# Altium project STM32 DevBoard.PrjPcb
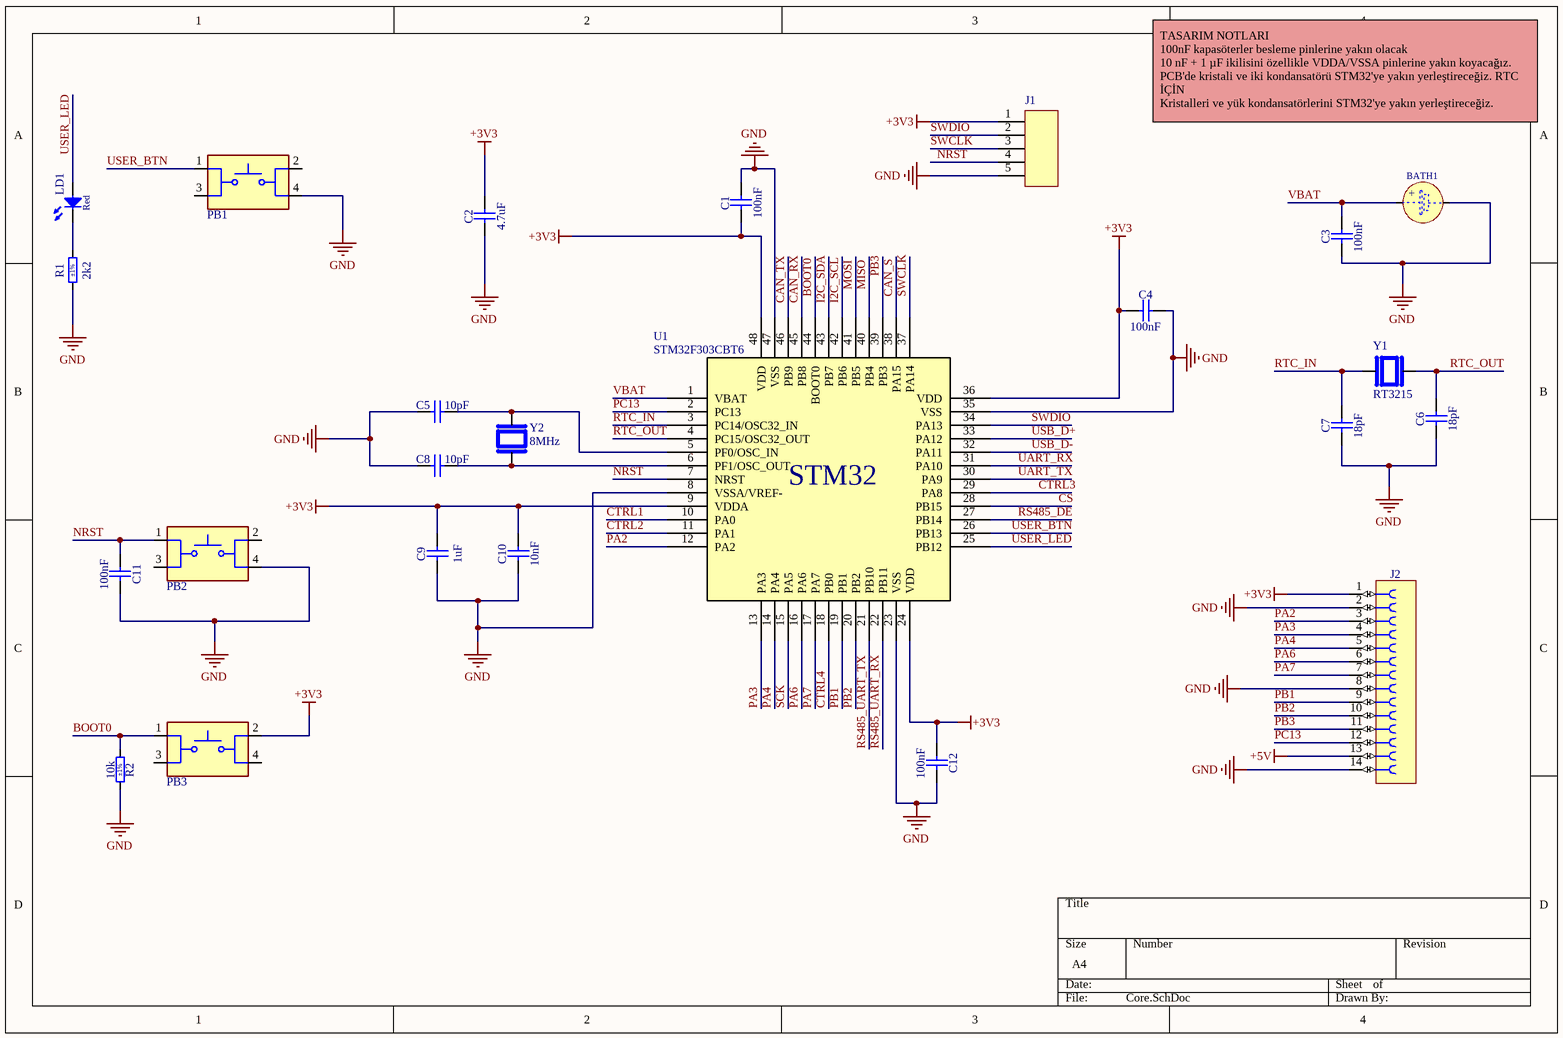
[diagram p0: Core.SchDoc]
3 sheets, 79 parts. Net scope: global (net labels, ports and power ports of the same name join across sheets).
Board file: STM32_DevBoard.PcbDoc
Sheets:
  Core.SchDoc
  Power.SchDoc
  Com.SchDoc

## Sheet Core.SchDoc
size A4; SheetNumber: 1; SheetTotal: 3

### Parts
BATH1  (no value)  [BATH_KEYSTONE_3000]
C1  100nF  [CAPC1608X87N]
C2  4.7uF  [CAPC1608X90N]
C3  100nF  [CAPC1608X87N]
C4  100nF  [CAPC1608X87N]
C5  10pF  [CAPC1608X87N]
C6  18pF  [CAPC1608X87N]
C7  18pF  [CAPC1608X87N]
C8  10pF  [CAPC1608X87N]
C9  1uF  [CAPC1608X87N]
C10  10nF  [CAPC1608X87N]
C11  100nF  [CAPC1608X87N]
C12  100nF  [CAPC1608X87N]
J1  Pin Header 1x5  [Pin Header 1x5 2.54mm]  (value not drawn)
J2  Socket 14  [SAMTEC_SSW-107-01-G-D]  (value not drawn)
LD1  Red  [LED_KINGBRIGHT_KPH-1608SURCK]
PB1  4.5mm x 4.5mm  [L-KLS7-TS4502-6.5-180-T]  (value not drawn)
PB2  4.5mm x 4.5mm  [L-KLS7-TS4502-6.5-180-T]  (value not drawn)
PB3  4.5mm x 4.5mm  [L-KLS7-TS4502-6.5-180-T]  (value not drawn)
R1  2k2  Tolerance: ±1%  [RESC1608X55N]
R2  10k  Tolerance: ±1%  [RESC1608X55N]
U1  STM32F303CBT6  [STM32F303CBT6]
Y1  RT3215  [RT3215-32.768-12.5-TR]
Y2  8MHz  [H130A-8.000-8-2030-TR]

### Nets
+3V3: C1.1 C2.2 C4.1 C9.2 C10.2 C12.1 J1.1 J2.1 PB3.2 U1.9(VDDA) U1.24(VDD) U1.36(VDD) U1.48(VDD)
+5V: J2.13
GND: BATH1.2(MINUS) C1.2 C2.1 C3.1 C4.2 C5.1 C6.1 C7.1 C8.1 C9.1 C10.1 C11.2 C12.2 J1.5 J2.2 J2.8 J2.14 PB1.4 PB2.4 R1.1 R2.2 U1.8(VSSA/VREF-) U1.23(VSS) U1.35(VSS) U1.47(VSS)
BOOT0: PB3.1 R2.1 U1.44(BOOT0)
CAN_RX: U1.45(PB8)
CAN_S: U1.38(PA15)
CAN_TX: U1.46(PB9)
CS: U1.28(PB15)
CTRL1: U1.10(PA0)
CTRL2: U1.11(PA1)
CTRL3: U1.29(PA8)
CTRL4: U1.18(PB0)
I2C_SCL: U1.42(PB6)
I2C_SDA: U1.43(PB7)
MISO: U1.40(PB4)
MOSI: U1.41(PB5)
NRST: C11.1 J1.4 PB2.1 U1.7(NRST)
PA2: J2.3 U1.12(PA2)
PA3: J2.4 U1.13(PA3)
PA4: J2.5 U1.14(PA4)
PA6: J2.6 U1.16(PA6)
PA7: J2.7 U1.17(PA7)
PB1: J2.9 U1.19(PB1)
PB2: J2.10 U1.20(PB2)
PB3: J2.11 U1.39(PB3)
PC13: J2.12 U1.2(PC13)
RS485_DE: U1.27(PB14)
RS485_UART_RX: U1.22(PB11)
RS485_UART_TX: U1.21(PB10)
RTC_IN: C7.2 U1.3(PC14/OSC32_IN) Y1.1
RTC_OUT: C6.2 U1.4(PC15/OSC32_OUT) Y1.2
SCK: U1.15(PA5)
SWCLK: J1.3 U1.37(PA14)
SWDIO: J1.2 U1.34(PA13)
UART_RX: U1.31(PA10)
UART_TX: U1.30(PA9)
USB_D+: U1.33(PA12)
USB_D-: U1.32(PA11)
USER_BTN: PB1.1 U1.26(PB13)
USER_LED: LD1.2(A) U1.25(PB12)
VBAT: BATH1.1(PLUS) C3.2 U1.1(VBAT)
NetC5_2: C5.2 U1.5(PF0/OSC_IN) Y2.2
NetC8_2: C8.2 U1.6(PF1/OSC_OUT) Y2.1
NetLD1_1: LD1.1(C) R1.2

Not connected (* = marked no-connect by the designer): PB1 2 3; PB2 2 3; PB3 3 4

### Notes on the sheet
- TASARIM NOTLARI
  100nF kapasöterler besleme pinlerine yakın olacak
  10 nF + 1 µF ikilisini özellikle VDDA/VSSA pinlerine yakın koyacağız.
  PCB'de kristali ve iki kondansatörü STM32'ye yakın yerleştireceğiz. RTC İÇİN
  Kristalleri ve yük kondansatörlerini STM32'ye yakın yerleştireceğiz.
- (in symbol BATH_KEYSTONE_3000) +
- (in symbol STM32F303CBT6) STM32

### Library data of the parts
BATH1 = BATH_KEYSTONE_3000: Battery Holder whit 2 Pin; Part Description: SMD Battery Holder for CR1216, BR1220, CL1225, SR1120, D381, 391, 191 Coin Cells; Manufacturer Part Number: 3000; PressFit: No; Part Number: BATH_KEYSTONE_3000; Component Kind: Standard; Component Type: Standard; Pin Count: 3; PackageDescription: SMD Battery Holder for CR1216, BR1220, CL1225, SR1120, D381, 391, 191 Coin Cells; Family: Battery; Mounted: Yes; Socket: No; SMD: Yes; Sense: No; Manufacturer: KEYSTONE; ComponentHeight: 3.17mm; HelpURL: \\cern.ch\dfs\Applications\Altium\Datasheets\BATH_KEYSTONE_3000.pdf; Author: CERN DEM JLC; CreateDate: 17.04.2012; LatestRevisionDate: 7.06.2017
C1 C3 C4 C11 C12 = CC0603_100NF_50V_10%_X5R: Non-polarised capacitor; Part Description: SMD Multilayer Chip Ceramic Capacitor; Manufacturer: GENERIC; Manufacturer1 Part Number: C1608X5R1H104K080; Voltage: 50V; TC: X5R; Tolerance: ±10%; Part Number: CC0603_100NF_50V_10%_X5R; Component Kind: Standard; Component Type: Standard; Pin Count: 2; Value: 100nF; Status: None; Manufacturer Part Number: CC0603_100NF_50V_10%_X5R; Case: 0603; Mounted: Yes; Socket: No; SMD: Yes; Sense: No; Manufacturer1 Example: TDK; Manufacturer1 ComponentHeight: 0.9mm; HelpURL: \\cern.ch\dfs\Applications\Altium\Datasheets\CC0603_X5R_TDK_C.pdf; Author: CERN DEM MR; CreateDate: 8.01.2016; LatestRevisionDate: 8.01.2016
C2 = CC0603_4.7UF_25V_10%_X5R: Non-polarised capacitor; Part Description: SMD Multilayer Chip Ceramic Capacitor; Manufacturer: GENERIC; Manufacturer1 Part Number: GRM188R61E475KE11D; Voltage: 25V; TC: X5R; Tolerance: ±10%; Part Number: CC0603_4.7UF_25V_10%_X5R; Component Kind: Standard; Component Type: Standard; Pin Count: 2; Value: 4.7uF; Status: None; Manufacturer Part Number: CC0603_4.7UF_25V_10%_X5R; Case: 0603; Mounted: Yes; Socket: No; SMD: Yes; Sense: No; Manufacturer1 Example: MURATA; Manufacturer1 ComponentHeight: 0.95mm; HelpURL: \\cern.ch\dfs\Applications\Altium\Datasheets\CC0603_MURATA_GRM188R61E475KE11D.pdf; Author: CERN DEM JLC; CreateDate: 10.11.2014; LatestRevisionDate: 10.11.2014
C5 C8 = CC0603_10PF_50V_5%_NP0: Non-polarised capacitor; Part Description: SMD Multilayer Chip Ceramic Capacitor; Manufacturer: GENERIC; Manufacturer1 Part Number: 223886715109; Voltage: 50V; TC: C0G/NP0; Tolerance: ±5%; Part Number: CC0603_10PF_50V_5%_NP0; Component Kind: Standard; Component Type: Standard; Pin Count: 2; Value: 10pF; Status: Preferred; Manufacturer Part Number: CC0603_10PF_50V_5%_NP0; Case: 0603; Mounted: Yes; Socket: No; SMD: Yes; Sense: No; Manufacturer1 Example: PHYCOMP; Manufacturer1 ComponentHeight: 0.87mm; HelpURL: \\cern.ch\dfs\Applications\Altium\Datasheets\CC0603_NP0_PHYCOMP.pdf; Author: CERN DEM JLC; CreateDate: 3.12.2007; LatestRevisionDate: 3.12.2007
C6 C7 = CC0603_18PF_50V_5%_NP0: Non-polarised capacitor; Part Description: SMD Multilayer Chip Ceramic Capacitor; Manufacturer: GENERIC; Manufacturer1 Part Number: 223886715189; Voltage: 50V; TC: C0G/NP0; Tolerance: ±5%; Part Number: CC0603_18PF_50V_5%_NP0; Component Kind: Standard; Component Type: Standard; Pin Count: 2; Value: 18pF; Status: Preferred; Manufacturer Part Number: CC0603_18PF_50V_5%_NP0; Case: 0603; Mounted: Yes; Socket: No; SMD: Yes; Sense: No; Manufacturer1 Example: PHYCOMP; Manufacturer1 ComponentHeight: 0.87mm; HelpURL: \\cern.ch\dfs\Applications\Altium\Datasheets\CC0603_NP0_PHYCOMP.pdf; Author: CERN DEM JLC; CreateDate: 3.12.2007; LatestRevisionDate: 3.12.2007
C9 = CC0603_1UF_25V_10%_X7R: Non-polarised capacitor; Part Description: SMD Multilayer Chip Ceramic Capacitor; Manufacturer: GENERIC; Manufacturer1 Part Number: GRM188R71E105KA12D; Voltage: 25V; TC: X7R; Tolerance: ±10%; Part Number: CC0603_1UF_25V_10%_X7R; Component Kind: Standard; Component Type: Standard; Pin Count: 2; Value: 1uF; Status: None; Manufacturer Part Number: CC0603_1UF_25V_10%_X7R; Case: 0603; Mounted: Yes; Socket: No; SMD: Yes; Sense: No; Manufacturer1 Example: MURATA; Manufacturer1 ComponentHeight: 0.9mm; HelpURL: \\cern.ch\dfs\Applications\Altium\Datasheets\CC0603_X7R_MURATA.pdf; Author: CERN DEM JLC; CreateDate: 18.01.2011; LatestRevisionDate: 18.01.2011
C10 = CC0603_10NF_50V_10%_X7R: Non-polarised capacitor; Part Description: SMD Multilayer Chip Ceramic Capacitor; Manufacturer: GENERIC; Manufacturer1 Part Number: 223858615636; Voltage: 50V; TC: X7R; Tolerance: ±10%; Part Number: CC0603_10NF_50V_10%_X7R; Component Kind: Standard; Component Type: Standard; Pin Count: 2; Value: 10nF; Status: Preferred; Manufacturer Part Number: CC0603_10NF_50V_10%_X7R; Case: 0603; Mounted: Yes; Socket: No; SMD: Yes; Sense: No; Manufacturer1 Example: PHYCOMP; Manufacturer1 ComponentHeight: 0.87mm; HelpURL: \\cern.ch\dfs\Applications\Altium\Datasheets\CC0603_X7R_PHYCOMP.pdf; Author: CERN DEM JLC; CreateDate: 3.12.2007; LatestRevisionDate: 3.12.2007
J1 = Pin Header 1x5 2.54mm: PIN HEADER 5PIN(1x5) 2.54mm THT V/T 3X6MM
J2 = SAMTEC_SSW-107-01-G-D: Connector 14 Female; Part Description: 14 Contacts, Pitch 2.54mm, Dual Row Through Mount Straight Socket (Lead Length 2.64mm); Manufacturer: SAMTEC; PressFit: No; Part Number: SAMTEC_SSW-107-01-G-D; Component Kind: Standard; Component Type: Standard; Pin Count: 14; Family: Socket 14; Mounted: Yes; Socket: No; SMD: No; Sense: No; Status: None; Manufacturer Part Number: SSW-107-01-G-D; ComponentHeight: 8.51mm; HelpURL: \\cern.ch\dfs\Applications\Altium\Datasheets\SAMTEC_SSW-107-01-G-D.pdf; Author: CERN DEM MR; CreateDate: 10.03.2016; LatestRevisionDate: 10.03.2016
LD1 = LED_KINGBRIGHT_KPH-1608SURCK: LED Red 1C 2A; Part Description: SMD Hyper Red LED, Case 1.6mmX0.8mm(0603), 0.65mm Thickness; PressFit: No; Bonding: No; Part Number: LED_KINGBRIGHT_KPH-1608SURCK; Component Kind: Standard; Component Type: Standard; Color: Red; PackageDescription: SMT Hyper Red LED, Case 0603, Body L 1.6 x W 0.8mm H 0.65mm; Manufacturer: KINGBRIGHT; Manufacturer Part Number: KPH-1608SURCK; Pin Count: 2; Case: 0603; Mounted: Yes; Socket: No; SMD: Yes; Sense: No; ComponentHeight: 0.65mm; HelpURL: \\cern.ch\dfs\Applications\Altium\Datasheets\LED_KINGBRIGHT_KPH-1608SURCK.pdf; Author: CERN DEM JLC; CreateDate: 3.07.2017; LatestRevisionDate: 3.07.2017
PB1-PB3 = L-KLS7-TS4502-6.5-180-T: SWITCH TACT 4.5x4.5MM 6.5MM 180gf SMD
R1 = R0603_2K2_1%_0.1W_100PPM: Resistor - 1%; Part Description: General Purpose Thick Film Chip Resistor; Manufacturer: GENERIC; Manufacturer1 Part Number: NRC06F2201TRF; Power: 0.1W; TC: ±100ppm/°C; PressFit: No; Part Number: R0603_2K2_1%_0.1W_100PPM; Component Kind: Standard; Component Type: Standard; Pin Count: 2; Value: 2k2; Status: Preferred; Manufacturer Part Number: R0603_2K2_1%_0.1W_100PPM; Case: 0603; Mounted: Yes; Sense: No; Socket: No; SMD: Yes; Manufacturer1 Example: NIC COMPONENT; Manufacturer1 ComponentHeight: 0.55mm; HelpURL: \\cern.ch\dfs\Applications\Altium\Datasheets\R0603_NIC_NRC.pdf; Author: CERN DEM JLC; CreateDate: 3.12.2007; LatestRevisionDate: 13.03.2008
R2 = R0603_10K_1%_0.1W_100PPM: Resistor - 1%; Part Description: General Purpose Thick Film Chip Resistor; Manufacturer: GENERIC; Manufacturer1 Part Number: NRC06F1002TRF; Power: 0.1W; TC: ±100ppm/°C; PressFit: No; Part Number: R0603_10K_1%_0.1W_100PPM; Component Kind: Standard; Component Type: Standard; Pin Count: 2; Value: 10k; Status: Preferred; Manufacturer Part Number: R0603_10K_1%_0.1W_100PPM; Case: 0603; Mounted: Yes; Sense: No; Socket: No; SMD: Yes; Manufacturer1 Example: NIC COMPONENT; Manufacturer1 ComponentHeight: 0.55mm; HelpURL: \\cern.ch\dfs\Applications\Altium\Datasheets\R0603_NIC_NRC.pdf; Author: CERN DEM JLC; CreateDate: 3.12.2007; LatestRevisionDate: 13.03.2008
Y1 = RT3215-32.768-12.5-TR: CRYSTAL 32.768kHz 12.5pF 20PPM SMD TR
Y2 = H130A-8.000-8-2030-TR: CRYSTAL 8MHz 8pF 20PPM SMT

## Sheet Power.SchDoc
size A4; SheetNumber: 2; SheetTotal: 3
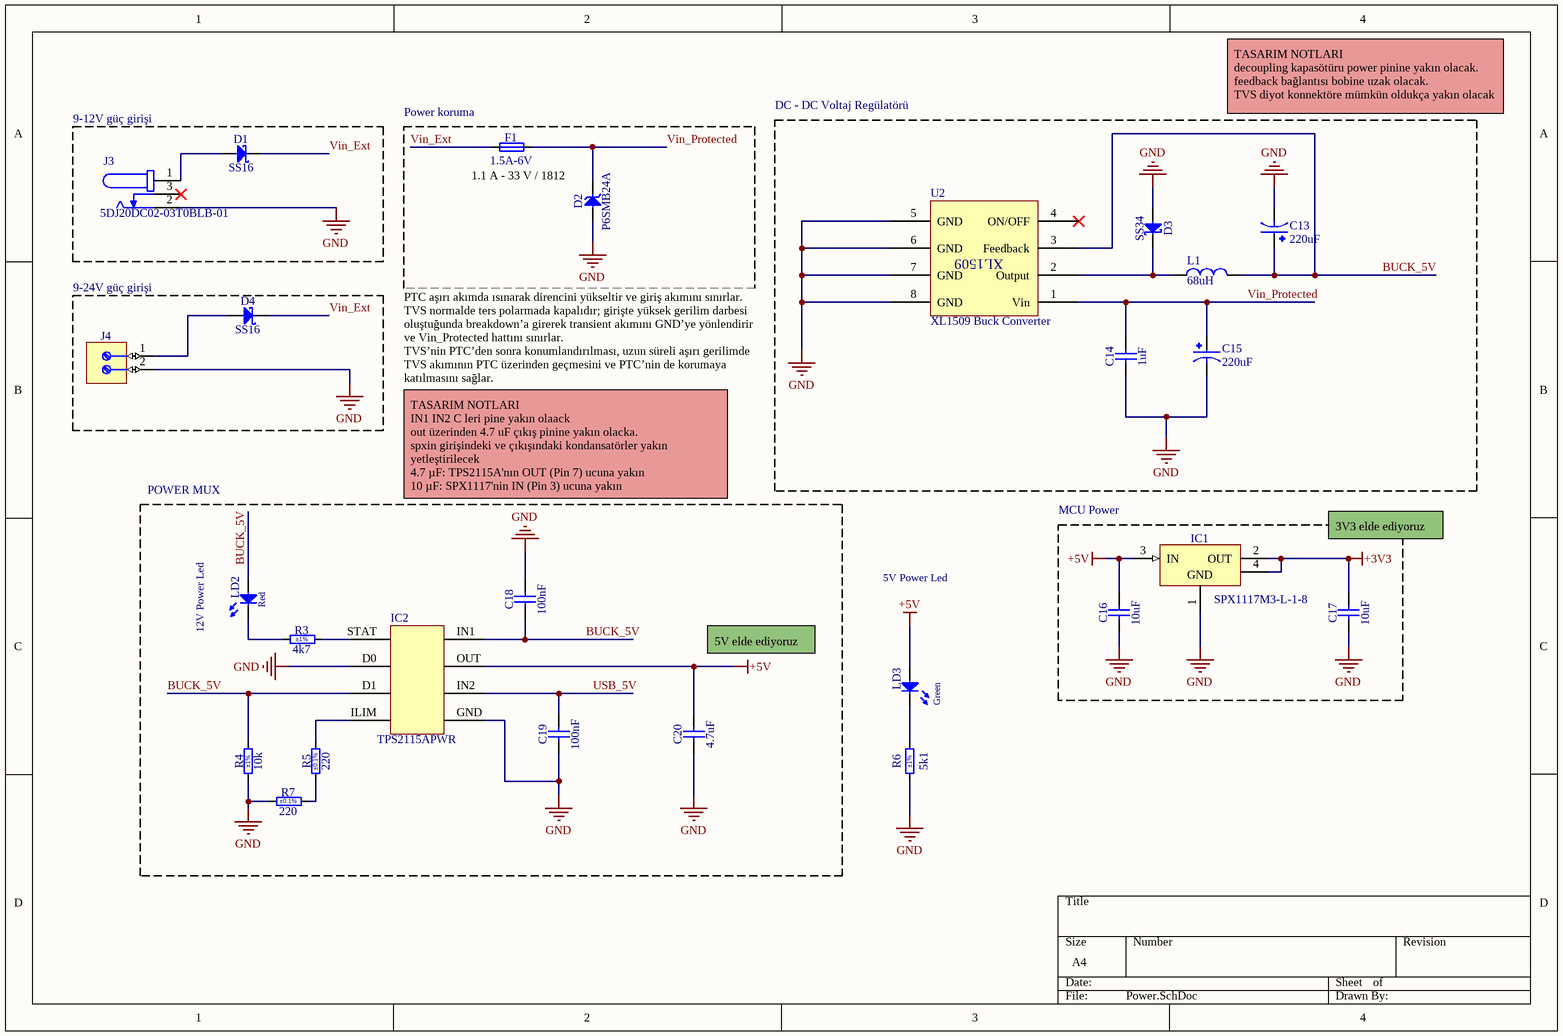
[diagram p1: Power.SchDoc]

### Parts
C13  220uF  [CD035M221G10PKKKV00A]
C14  1uF  [CAPC2012X110N]
C15  220uF  [CD035M221G10PKKKV00A]
C16  10uF  [CAPC1608X80N]
C17  10uF  [CAPC1608X80N]
C18  100nF  [CAPC1608X87N]
C19  100nF  [CAPC1608X87N]
C20  4.7uF  [CAPC1608X90N]
D1  SS16  [DIOM5127X229N]
D2  P6SMB24A  [DIOM5436X261N]
D3  SS34  [DIOM7959X265N]
D4  SS16  [DIOM5127X229N]
F1  1.5A-6V  [FUSRC4632X90N]
IC1  SPX1117M3-L-1-8  [SOT230P700X180-4N]
IC2  TPS2115APWR  [TPS2115APWR]
J3  5DJ20DC02-03T0BLB-01  [5DJ20DC02-03T0BLB-01]
J4  (no value)  [PHOENIX_1751248]
L1  68uH  [SRI1207-680M]
LD2  Red  [LED_KINGBRIGHT_KPH-1608SURCK]
LD3  Green  [LED_KINGBRIGHT_KP-1608CGCK]
R3  4k7  Tolerance: ±1%  [RESC1608X55N]
R4  10k  Tolerance: ±1%  [RESC1608X55N]
R5  220  Tolerance: ±0.1%  [RESC1608X64N]
R6  5k1  Tolerance: ±1%  [RESC1608X55N]
R7  220  Tolerance: ±0.1%  [RESC1608X64N]
U2  XL1509 Buck Converter  [XL1509-5.0E1]

### Blocks framed on the sheet
9-12V güç girişi: D1 J3
Power koruma: D2 F1
DC - DC Voltaj Regülatörü: C13-C15 D3 L1 U2
9-24V güç girişi: D4 J4
POWER MUX: C18-C20 IC2 LD2 R3-R5 R7
MCU Power: C16 C17 IC1

### Nets
+3V3: C17.2 IC1.2(OUT) IC1.4(OUT)
+5V: C16.2 C20.2 IC1.3(IN) IC2.OUT LD3.2(A)
GND: C13.2(N) C14.1 C15.2(N) C16.1 C17.1 C18.2 C19.1 C20.1 D2.2(A) D3.2(A) IC1.1(GND) IC2.D0 IC2.GND J3.2(SWITCH) J4.2 R4.1 R6.1 R7.1 U2.5(GND) U2.6(GND) U2.7(GND) U2.8(GND)
BUCK_5V: C13.1(P) C18.1 IC2.D1 IC2.IN1 L1.2 LD2.2(A) R4.2 U2.3(Feedback)
USB_5V: C19.2 IC2.IN2
Vin_Ext: D1.1(C) D4.1(C) F1.1
Vin_Protected: C14.2 C15.1(P) D2.1(C) F1.2 U2.1(Vin)
NetD1_2: D1.2(A) J3.1(Vin)
NetD3_1: D3.1(C) L1.1 U2.2(Output)
NetD4_2: D4.2(A) J4.1
NetIC2_ILIM: IC2.ILIM R5.2
NetIC2_STAT: IC2.STAT R3.2
NetLD2_1: LD2.1(C) R3.1
NetLD3_1: LD3.1(C) R6.2
NetR5_1: R5.1 R7.2

Not connected (* = marked no-connect by the designer): J3 3(GND)*; U2 4(ON/OFF)*

### Notes on the sheet
- TASARIM NOTLARI
  decoupling kapasötüru power pinine yakın olacak.
  feedback bağlantısı bobine uzak olacak.
  TVS diyot konnektöre mümkün oldukça yakın olacak
- 1.1 A - 33 V / 1812
- PTC aşırı akımda ısınarak direncini yükseltir ve giriş akımını sınırlar.
  TVS normalde ters polarmada kapalıdır; girişte yüksek gerilim darbesi oluştuğunda breakdown’a girerek transient akımını GND’ye yönlendirir ve Vin_Protected hattını sınırlar.
  TVS’nin PTC’den sonra konumlandırılması, uzun süreli aşırı gerilimde TVS akımının PTC üzerinden geçmesini ve PTC’nin de korumaya katılmasını sağlar.
- TASARIM NOTLARI
  IN1 IN2 C leri pine yakın olaack
  out üzerinden 4.7 uF çıkış pinine yakın olacka.
  spxin girişindeki ve çıkışındaki kondansatörler yakın yetleştirilecek
  4.7 µF: TPS2115A'nın OUT (Pin 7) ucuna yakın
  10 µF: SPX1117'nin IN (Pin 3) ucuna yakın
- 5V Power Led
- 3V3 elde ediyoruz
- (near LD2) 12V Power Led
- 5V elde ediyoruz
- (in symbol XL1509-5.0E1) XL1509

### Library data of the parts
C13 C15 = CD035M221G10PKKKV00A: CAP.ALU 220uF 35V 10x10 ±20% 3000 Hrs @ 105 °C Radial Electrolytic AEC-Q200 SMT
C14 = CC0805_1UF_50V_10%_X7R: Non-polarised capacitor; Part Description: SMD Multilayer Chip Ceramic Capacitor; Manufacturer: GENERIC; Manufacturer1 Part Number: C0805C105K5RACTU; Voltage: 50V; TC: X7R; Tolerance: ±10%; Part Number: CC0805_1UF_50V_10%_X7R; Component Kind: Standard; Component Type: Standard; Pin Count: 2; Value: 1uF; Status: Preferred; Manufacturer Part Number: CC0805_1UF_50V_10%_X7R; Case: 0805; Mounted: Yes; Socket: No; SMD: Yes; Sense: No; Manufacturer1 Example: KEMET; Manufacturer1 ComponentHeight: 1.1mm; HelpURL: \\cern.ch\dfs\Applications\Altium\Datasheets\CC0805_X7R_KEMET.pdf; Author: CERN DEM JLC; CreateDate: 4.12.2013; LatestRevisionDate: 4.12.2013
C16 C17 = CC0603_10UF_10V_10%_X5R: Non-polarised capacitor; Part Description: SMD Multilayer Chip Ceramic Capacitor; Manufacturer: GENERIC; Manufacturer1 Part Number: GRM188R61A106KE69D; Voltage: 10V; TC: X5R; Tolerance: ±10%; Part Number: CC0603_10UF_10V_10%_X5R; Component Kind: Standard; Component Type: Standard; Pin Count: 2; Value: 10uF; Status: None; Manufacturer Part Number: CC0603_10UF_10V_10%_X5R; Case: 0603; Mounted: Yes; Socket: No; SMD: Yes; Sense: No; Manufacturer1 Example: MURATA; Manufacturer1 ComponentHeight: 0.8mm; HelpURL: \\cern.ch\dfs\Applications\Altium\Datasheets\CC0603_MURATA_GRM188R61A106KE69D.pdf; Author: CERN DEM JLC; CreateDate: 31.01.2017; LatestRevisionDate: 31.01.2017
C18 C19 = CC0603_100NF_50V_10%_X5R: as C1 on sheet Core; Part Number: CC0603_100NF_50V_10%_X5R; Component Kind: Standard; Component Type: Standard; Pin Count: 2; Value: 100nF; Status: None; Manufacturer Part Number: CC0603_100NF_50V_10%_X5R; Case: 0603; Mounted: Yes; Socket: No; SMD: Yes; Sense: No; Manufacturer1 Example: TDK; Manufacturer1 ComponentHeight: 0.9mm; HelpURL: \\cern.ch\dfs\Applications\Altium\Datasheets\CC0603_X5R_TDK_C.pdf; Author: CERN DEM MR; CreateDate: 8.01.2016; LatestRevisionDate: 8.01.2016
C20 = CC0603_4.7UF_25V_10%_X5R: as C2 on sheet Core; Part Number: CC0603_4.7UF_25V_10%_X5R; Component Kind: Standard; Component Type: Standard; Pin Count: 2; Value: 4.7uF; Status: None; Manufacturer Part Number: CC0603_4.7UF_25V_10%_X5R; Case: 0603; Mounted: Yes; Socket: No; SMD: Yes; Sense: No; Manufacturer1 Example: MURATA; Manufacturer1 ComponentHeight: 0.95mm; HelpURL: \\cern.ch\dfs\Applications\Altium\Datasheets\CC0603_MURATA_GRM188R61E475KE11D.pdf; Author: CERN DEM JLC; CreateDate: 10.11.2014; LatestRevisionDate: 10.11.2014
D1 D4 = SS16: Schottky Diode; Part Description: Surface Mount Schottky Barrier Rectifier; Manufacturer: VISHAY GENERAL SEMICONDUCTOR; Voltage: 60V; Power: 1A; PressFit: No; Bonding: No; Part Number: SS16; Component Kind: Standard; Component Type: Standard; Device: SS16; PackageDescription: DO-214-AC/SMA Diode, Molded Body; 5.10mm L X 2.67mm W X 2.29mm H, IPC Medium Density; Manufacturer Part Number: SS16; Pin Count: 2; Case: DO-214AC; Mounted: Yes; Socket: No; SMD: Yes; Sense: No; ComponentHeight: 2.29mm; HelpURL: \\cern.ch\dfs\Applications\Altium\Datasheets\SS16.pdf; Author: CERN DEM JLC; CreateDate: 15.07.2008; LatestRevisionDate: 23.08.2010
D2 = P6SMB24A: Transient Voltage Suppressor Diode (Uni-Directional); Part Description: Uni-directional Transient Voltage Suppressor (TVS) Diode; Manufacturer: LITTELFUSE; Voltage: 24V; Power: 600W; PressFit: No; Bonding: No; Part Number: P6SMB24A; Component Kind: Standard; Component Type: Standard; Device: P6SMB24A; PackageDescription: DO-214-AA/SMB Diode, Molded Body; 5.40mm L X 3.62mm W X 2.61mm H, IPC Medium Density; Manufacturer Part Number: P6SMB24A; Pin Count: 2; Case: SMB; Mounted: Yes; Socket: No; SMD: Yes; Sense: No; ComponentHeight: 2.61mm; HelpURL: \\cern.ch\dfs\Applications\Altium\Datasheets\P6SMB24A.pdf; Author: CERN DEM JLC; CreateDate: 12.07.2017; LatestRevisionDate: 12.07.2017
D3 = SS34: Schottky Diode; Part Description: Surface Mount Schottky Barrier Rectifier; Manufacturer: FAIRCHILD SEMICONDUCTOR; Voltage: 40V; Power: 3A; PressFit: No; Bonding: No; Part Number: SS34; Component Kind: Standard; Component Type: Standard; Device: SS34; PackageDescription: DO-214-AB/SMC Molded Diode, Body 7.95x5.9mm, IPC Medium Density; Manufacturer Part Number: SS34; Pin Count: 2; Case: DO-214AB; Mounted: Yes; Socket: No; SMD: Yes; Sense: No; ComponentHeight: 2.65mm; HelpURL: \\cern.ch\dfs\Applications\Altium\Datasheets\SS34.pdf; Author: CERN DEM JLC; CreateDate: 23.08.2010; LatestRevisionDate: 8.11.2017
F1 = FUSR1812_LITTELFUSE_MINISMDC150F-2: Fuse; Part Description: PolySwitch® PTC Overcurrent Protection Device; PressFit: No; Part Number: FUSR1812_LITTELFUSE_MINISMDC150F-2; Component Kind: Standard; Component Type: Standard; Pin Count: 2; PackageDescription: Chip Resettable Fuse, 2-Leads, Body 4.6x3.2mm, IPC Medium Density; Family: Fuses Resettable; Mounted: Yes; Socket: No; SMD: Yes; Sense: No; Value: 1.5A-6V; Manufacturer: LITTELFUSE; Manufacturer Part Number: miniSMDC150F-2; ComponentHeight: 0.76mm; HelpURL: \\cern.ch\dfs\Applications\Altium\Datasheets\FUSR_LITTELFUSE_MINISMDC150F-2.pdf; Author: CERN DEM MR; CreateDate: 20.07.2017; LatestRevisionDate: 17.08.2017
IC1 = SPX1117M3-L-1-8: 3-Terminal Regulator 1=GND 2=OUT 3=IN 4=OUT; Part Description: 1.8V 800mA Low Dropout Voltage Regulator; Manufacturer: EXAR; PressFit: No; Bonding: No; Part Number: SPX1117M3-L-1-8; Component Kind: Standard; Component Type: Standard; Device: SPX1117M3-L-1-8; PackageDescription: SOT223, 2.30mm Pitch; 4 Pin, 3.70mm W X 6.70mm L X 1.80mm H body, IPC Medium Density; Manufacturer Part Number: SPX1117M3-L-1-8; Pin Count: 4; Case: SOT223; Mounted: Yes; Socket: No; SMD: Yes; Sense: No; ComponentHeight: 1.8mm; HelpURL: \\cern.ch\dfs\Applications\Altium\Datasheets\SPX1117M3-L-1-8.pdf; Author: CERN DEM JLC; CreateDate: 5.07.2011; LatestRevisionDate: 5.07.2011
IC2 = TPS2115APWR Autoswitching Power Mux: IC-2115 OR CONTROLLER SRC SELECT 8-TSSOP
J3 = 5DJ20DC02-03T0BLB-01: Connector, dc jack 5.5x2.1 mm, PCB mount, 90 degrees, nickel plated, PBT, thru hole
J4 = PHOENIX_1751248: Terminal Block, 2 Positions, Screw Connection; Part Description: 10A 160V, Terminal Block, Pitch 3.5mm, 2 Positions, Screw Connection; Manufacturer: PHOENIX CONTACT; Manufacturer Part Number: 1751248 (MKDS 1/ 2-3,5); PressFit: No; Part Number: PHOENIX_1751248; Component Kind: Standard; Component Type: Standard; Pin Count: 2; Mounted: Yes; Socket: No; SMD: No; Sense: No; Status: None; ComponentHeight: 8.5mm; HelpURL: \\cern.ch\dfs\Applications\Altium\Datasheets\PHOENIX_1751248.pdf; Author: CERN DEM JLC; CreateDate: 3.11.2009; LatestRevisionDate: 26.04.2010
L1 = SRI1207-680M: INDUCTOR POWER 68UH 12X12MM SMD 3.8 A
LD2 = LED_KINGBRIGHT_KPH-1608SURCK: as LD1 on sheet Core; Part Number: LED_KINGBRIGHT_KPH-1608SURCK; Component Kind: Standard; Component Type: Standard; Color: Red; PackageDescription: SMT Hyper Red LED, Case 0603, Body L 1.6 x W 0.8mm H 0.65mm; Manufacturer: KINGBRIGHT; Manufacturer Part Number: KPH-1608SURCK; Pin Count: 2; Case: 0603; Mounted: Yes; Socket: No; SMD: Yes; Sense: No; ComponentHeight: 0.65mm; HelpURL: \\cern.ch\dfs\Applications\Altium\Datasheets\LED_KINGBRIGHT_KPH-1608SURCK.pdf; Author: CERN DEM JLC; CreateDate: 3.07.2017; LatestRevisionDate: 3.07.2017
LD3 = LED_KINGBRIGHT_KP-1608CGCK: LED Green 1C 2A; Part Description: 1.6x0.8mm SMD Chip Green LED Lamp; PressFit: No; Bonding: No; Part Number: LED_KINGBRIGHT_KP-1608CGCK; Component Kind: Standard; Component Type: Standard; Color: Green; PackageDescription: SMT Green LED, Case 0603, Body L 1.60mm x W 0.80mm x H 1.10mm; Manufacturer: KINGBRIGHT; Manufacturer Part Number: KP-1608CGCK; Pin Count: 2; Case: 0603; Mounted: Yes; Socket: No; SMD: Yes; Sense: No; ComponentHeight: 1.1mm; HelpURL: \\cern.ch\dfs\Applications\Altium\Datasheets\LED_KINGBRIGHT_KP-1608CGCK.pdf; Author: CERN DEM HF; CreateDate: 1.10.2021; LatestRevisionDate: 1.10.2021
R3 = R0603_4K7_1%_0.1W_100PPM: Resistor - 1%; Part Description: General Purpose Thick Film Chip Resistor; Manufacturer: GENERIC; Manufacturer1 Part Number: NRC06F4701TRF; Power: 0.1W; TC: ±100ppm/°C; PressFit: No; Part Number: R0603_4K7_1%_0.1W_100PPM; Component Kind: Standard; Component Type: Standard; Pin Count: 2; Value: 4k7; Status: Preferred; Manufacturer Part Number: R0603_4K7_1%_0.1W_100PPM; Case: 0603; Mounted: Yes; Sense: No; Socket: No; SMD: Yes; Manufacturer1 Example: NIC COMPONENT; Manufacturer1 ComponentHeight: 0.55mm; HelpURL: \\cern.ch\dfs\Applications\Altium\Datasheets\R0603_NIC_NRC.pdf; Author: CERN DEM JLC; CreateDate: 3.12.2007; LatestRevisionDate: 13.03.2008
R4 = R0603_10K_1%_0.1W_100PPM: as R2 on sheet Core; Part Number: R0603_10K_1%_0.1W_100PPM; Component Kind: Standard; Component Type: Standard; Pin Count: 2; Value: 10k; Status: Preferred; Manufacturer Part Number: R0603_10K_1%_0.1W_100PPM; Case: 0603; Mounted: Yes; Sense: No; Socket: No; SMD: Yes; Manufacturer1 Example: NIC COMPONENT; Manufacturer1 ComponentHeight: 0.55mm; HelpURL: \\cern.ch\dfs\Applications\Altium\Datasheets\R0603_NIC_NRC.pdf; Author: CERN DEM JLC; CreateDate: 3.12.2007; LatestRevisionDate: 13.03.2008
R5 R7 = R0603_220R_0.1%_0.1W_25PPM: Resistor - 0.1%; Part Description: Thin Film Chip Resistor; Manufacturer: GENERIC; Manufacturer1 Part Number: ERA3AEB221V; Power: 0.1W; TC: ±25ppm/°C; PressFit: No; Part Number: R0603_220R_0.1%_0.1W_25PPM; Component Kind: Standard; Component Type: Standard; Pin Count: 2; Value: 220; Status: Not Recommended; Manufacturer Part Number: R0603_220R_0.1%_0.1W_25PPM; Case: 0603; Mounted: Yes; Sense: No; Socket: No; SMD: Yes; Manufacturer1 Example: PANASONIC; Manufacturer1 ComponentHeight: 0.55mm; HelpURL: \\cern.ch\dfs\Applications\Altium\Datasheets\R0603_PANASONIC_ERA.pdf; Author: CERN DEM JLC; CreateDate: 12.01.2017; LatestRevisionDate: 12.01.2017
R6 = R0603_5K1_1%_0.1W_100PPM: Resistor - 1%; Part Description: General Purpose Thick Film Chip Resistor; Manufacturer: GENERIC; Manufacturer1 Part Number: NRC06F5101TRF; Power: 0.1W; TC: ±100ppm/°C; PressFit: No; Part Number: R0603_5K1_1%_0.1W_100PPM; Component Kind: Standard; Component Type: Standard; Pin Count: 2; Value: 5k1; Status: Preferred; Manufacturer Part Number: R0603_5K1_1%_0.1W_100PPM; Case: 0603; Mounted: Yes; Sense: No; Socket: No; SMD: Yes; Manufacturer1 Example: NIC COMPONENT; Manufacturer1 ComponentHeight: 0.55mm; HelpURL: \\cern.ch\dfs\Applications\Altium\Datasheets\R0603_NIC_NRC.pdf; Author: CERN DEM JLC; CreateDate: 3.12.2007; LatestRevisionDate: 13.03.2008
U2 = XL1509-5.0E1: IC-1509 REG BUCK DC/DC CONVERTER 5V 8SOP

## Sheet Com.SchDoc
size A4; SheetNumber: 3; SheetTotal: 3
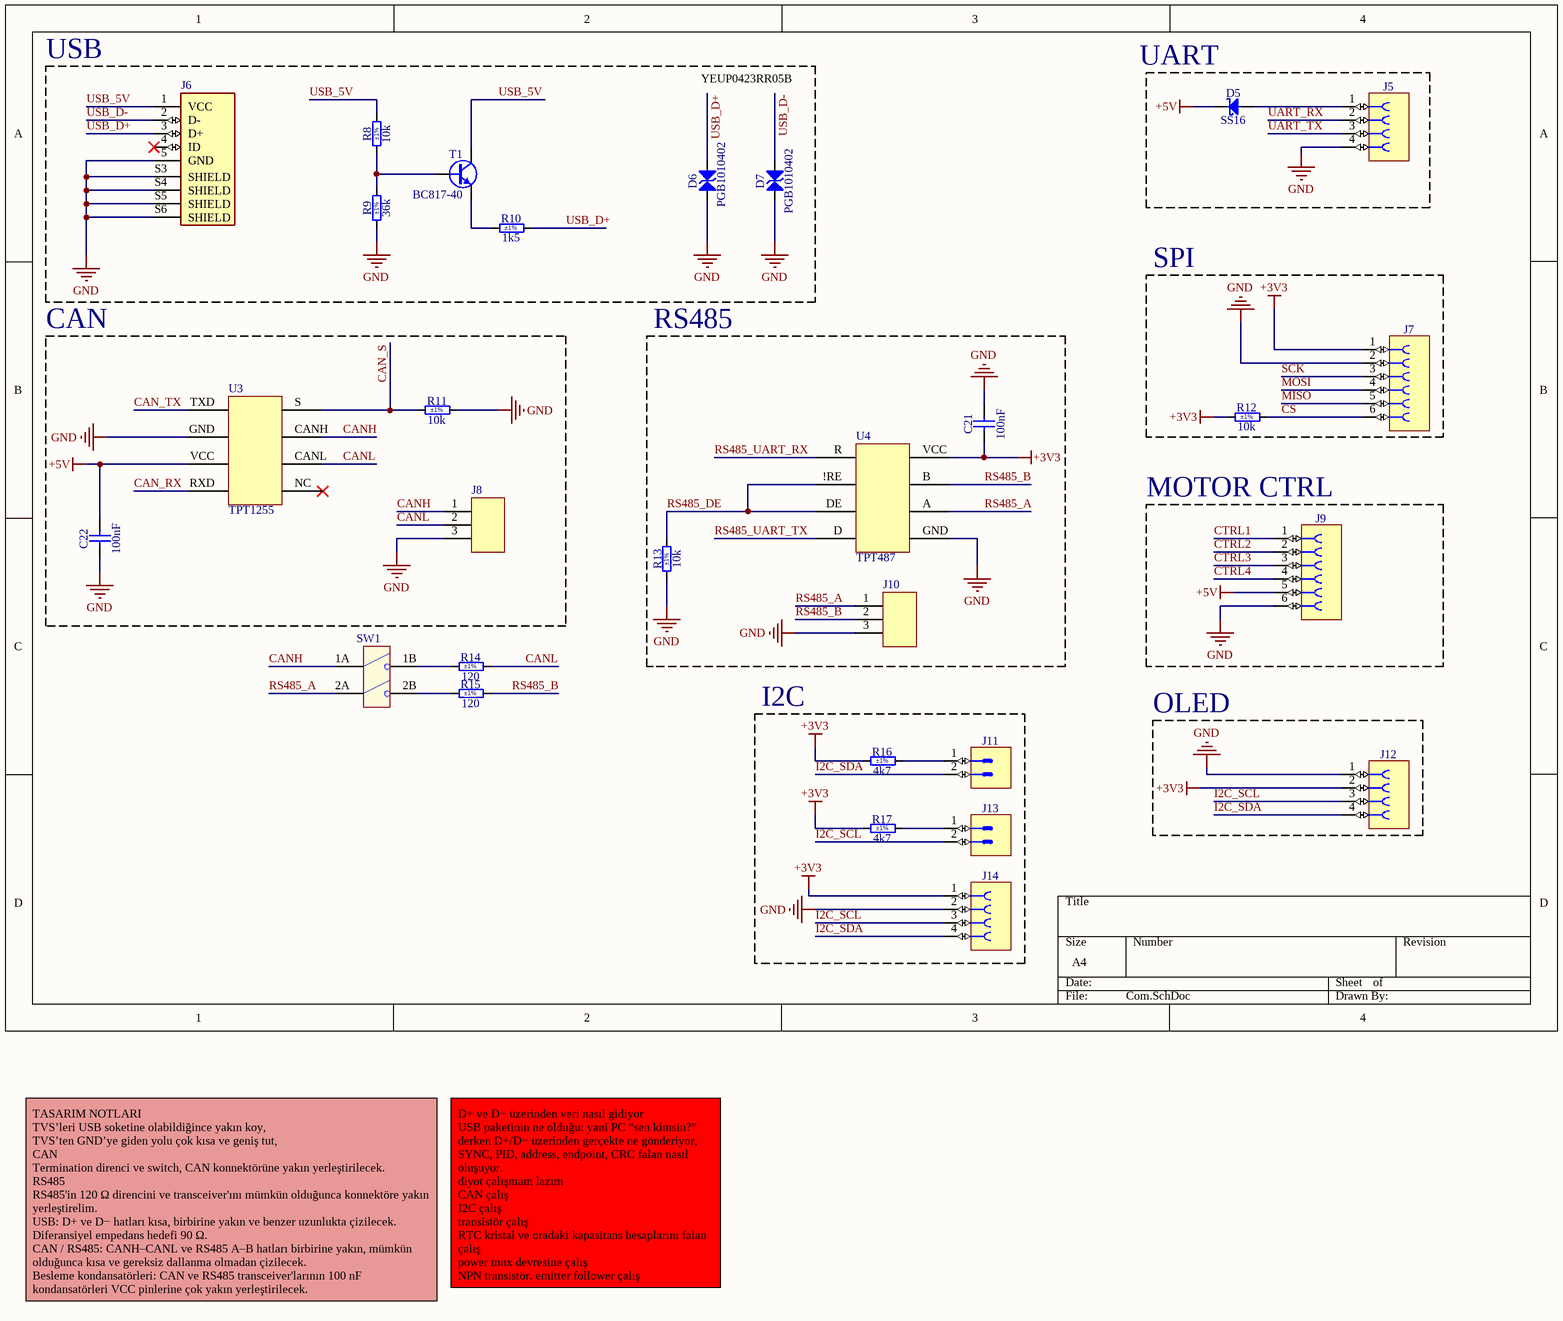
[diagram p2: Com.SchDoc]

### Parts
C21  100nF  [CAPC1608X87N]
C22  100nF  [CAPC1608X87N]
D5  SS16  [DIOM5127X229N]
D6  PGB1010402  [LITTELFUSE_PGB1010402]
D7  PGB1010402  [LITTELFUSE_PGB1010402]
J5  Socket 4  [SAMTEC_SSW-104-02-L-S]  (value not drawn)
J6  USB Micro B 5 Pin Female  [USB MICRO B]  (value not drawn)
J7  Socket 6  [SAMTEC_SSW-106-01-L-S]  (value not drawn)
J8  3 pin female header  [3 pin female hedaer]  (value not drawn)
J9  Socket 6  [SAMTEC_SSW-106-01-L-S]  (value not drawn)
J10  3 pin female header  [3 pin female hedaer]  (value not drawn)
J11  Header 2  [SAMTEC_HTSW-101-23-L-D]  (value not drawn)
J12  Socket 4  [SAMTEC_SSW-104-02-L-S]  (value not drawn)
J13  Header 2  [SAMTEC_HTSW-101-23-L-D]  (value not drawn)
J14  Socket 4  [SAMTEC_SSW-104-02-L-S]  (value not drawn)
R8  10k  Tolerance: ±1%  [RESC1608X55N]
R9  36k  Tolerance: ±1%  [RESC1608X55N]
R10  1k5  Tolerance: ±1%  [RESC1608X55N]
R11  10k  Tolerance: ±1%  [RESC1608X55N]
R12  10k  Tolerance: ±1%  [RESC1608X55N]
R13  10k  Tolerance: ±1%  [RESC1608X55N]
R14  120  Tolerance: ±1%  [RESC1608X55N]
R15  120  Tolerance: ±1%  [RESC1608X55N]
R16  4k7  Tolerance: ±1%  [RESC1608X55N]
R17  4k7  Tolerance: ±1%  [RESC1608X55N]
SW1  DS1040  [DS1040 2-DIP SW]  (value not drawn)
T1  BC817-40  [SOT95P230X110-3N]
U3  TPT1255  [TPT1255]
U4  TPT487  [TPT487]

### Blocks framed on the sheet
USB: D6 D7 J6 R8-R10 T1
SPI: J7 R12
CAN: C22 J8 R11 U3
MOTOR CTRL: J9
I2C: J11 J13 J14 R16 R17
OLED: J12

### Nets
+3V3: C21.1 J7.1 J12.2 J14.1 R12.1 R16.1 R17.1 U4.VCC
+5V: C22.2 D5.1(C) J9.5 U3.VCC
GND: C21.2 C22.1 D6.1 D7.1 J5.4 J6.5(GND) J6.S3(SHIELD) J6.S4(SHIELD) J6.S5(SHIELD) J6.S6(SHIELD) J7.2 J8.3 J9.6 J10.3 J12.1 J14.2 R9.1 R11.2 R13.1 U3.GND U4.GND
CAN_RX: U3.RXD
CAN_S: R11.1 U3.S
CAN_TX: U3.TXD
CANH: J8.1 SW1.1A(COM1) U3.CANH
CANL: J8.2 R14.2 U3.CANL
CS: J7.6 R12.2
CTRL1: J9.1
CTRL2: J9.2
CTRL3: J9.3
CTRL4: J9.4
I2C_SCL: J12.3 J13.2 J14.3
I2C_SDA: J11.2 J12.4 J14.4
MISO: J7.5
MOSI: J7.4
RS485_A: J10.1 SW1.2A(COM2) U4.A
RS485_B: J10.2 R15.2 U4.B
RS485_DE: R13.2 U4.!RE U4.DE
RS485_UART_RX: U4.R
RS485_UART_TX: U4.D
SCK: J7.3
UART_RX: J5.2
UART_TX: J5.3
USB_5V: J6.1(VCC) R8.2 T1.3(C)
USB_D+: D6.2 J6.3(D+) R10.2
USB_D-: D7.2 J6.2(D-)
NetD5_2: D5.2(A) J5.1
NetJ11_1: J11.1 R16.2
NetJ13_1: J13.1 R17.2
NetR8_1: R8.1 R9.2 T1.1(B)
NetR10_1: R10.1 T1.2(E)
NetR14_1: R14.1 SW1.1B(NO1)
NetR15_1: R15.1 SW1.2B(NO2)

Not connected (* = marked no-connect by the designer): J6 4(ID)*; U3 NC(5)*

### Notes on the sheet
- YEUP0423RR05B
- (near D5) UART
- RS485
- TASARIM NOTLARI
  TVS’leri USB soketine olabildiğince yakın koy,
  TVS’ten GND’ye giden yolu çok kısa ve geniş tut,
  CAN
  Termination direnci ve switch, CAN konnektörüne yakın yerleştirilecek.
  RS485
  RS485'in 120 Ω direncini ve transceiver'ını mümkün olduğunca konnektöre yakın yerleştirelim.
  USB: D+ ve D− hatları kısa, birbirine yakın ve benzer uzunlukta çizilecek. Diferansiyel empedans hedefi 90 Ω.
  CAN / RS485: CANH–CANL ve RS485 A–B hatları birbirine yakın, mümkün olduğunca kısa ve gereksiz dallanma olmadan çizilecek.
  Besleme kondansatörleri: CAN ve RS485 transceiver'larının 100 nF kondansatörleri VCC pinlerine çok yakın yerleştirilecek.
- D+ ve D− üzerinden veri nasıl gidiyor
  USB paketinin ne olduğu: yani PC “sen kimsin?” derken D+/D− üzerinden gerçekte ne gönderiyor, SYNC, PID, address, endpoint, CRC falan nasıl oluşuyor.
  diyot çalışmam lazım
  CAN çalış
  I2C çalış
  transistör çalış
  RTC kristal ve oradaki kapasitans hesaplarını falan çalış
  power mux devresine çalış
  NPN transistör. emitter follower çalış

### Library data of the parts
C21 C22 = CC0603_100NF_50V_10%_X5R: as C1 on sheet Core; Part Number: CC0603_100NF_50V_10%_X5R; Component Kind: Standard; Component Type: Standard; Pin Count: 2; Value: 100nF; Status: None; Manufacturer Part Number: CC0603_100NF_50V_10%_X5R; Case: 0603; Mounted: Yes; Socket: No; SMD: Yes; Sense: No; Manufacturer1 Example: TDK; Manufacturer1 ComponentHeight: 0.9mm; HelpURL: \\cern.ch\dfs\Applications\Altium\Datasheets\CC0603_X5R_TDK_C.pdf; Author: CERN DEM MR; CreateDate: 8.01.2016; LatestRevisionDate: 8.01.2016
D5 = SS16: as D1 on sheet Power; Part Number: SS16; Component Kind: Standard; Component Type: Standard; Device: SS16; PackageDescription: DO-214-AC/SMA Diode, Molded Body; 5.10mm L X 2.67mm W X 2.29mm H, IPC Medium Density; Manufacturer Part Number: SS16; Pin Count: 2; Case: DO-214AC; Mounted: Yes; Socket: No; SMD: Yes; Sense: No; ComponentHeight: 2.29mm; HelpURL: \\cern.ch\dfs\Applications\Altium\Datasheets\SS16.pdf; Author: CERN DEM JLC; CreateDate: 15.07.2008; LatestRevisionDate: 23.08.2010
D6 D7 = PGB1010402: Transient Voltage Suppressor Diode (Bi-Directional); Part Description: Pulse-Guard ESD Surface Mount Polymeric Electrostatic Discharge Suppressor; Manufacturer: LITTELFUSE; Voltage: 12V; PressFit: No; Bonding: No; Part Number: PGB1010402; Component Kind: Standard; Component Type: Standard; Device: PGB1010402; PackageDescription: 0402, 2-Leads, Body 1mm L X 0.51mm W X 0.39mm H body; Manufacturer Part Number: PGB1010402; Pin Count: 2; Case: 0402; Mounted: Yes; Socket: No; SMD: Yes; Sense: No; ComponentHeight: 0.39mm; HelpURL: \\cern.ch\dfs\Applications\Altium\Datasheets\PGB1010402.pdf; Author: CERN DEM BC; CreateDate: 20.02.2019; LatestRevisionDate: 20.02.2019
J5 J12 J14 = SAMTEC_SSW-104-02-L-S: Connector 4 Female; Part Description: 4 Contacts, Pitch 2.54mm, Single Row Through Mount Straight Socket (Lead Length 4.93mm); Manufacturer: SAMTEC; PressFit: No; Part Number: SAMTEC_SSW-104-02-L-S; Component Kind: Standard; Component Type: Standard; Pin Count: 4; Family: Socket 4; Mounted: Yes; Socket: No; SMD: No; Sense: No; Status: None; Manufacturer Part Number: SSW-104-02-L-S; ComponentHeight: 8.51mm; HelpURL: \\cern.ch\dfs\Applications\Altium\Datasheets\SAMTEC_SSW-104-02-L-S.pdf; Author: CERN DEM JLC; CreateDate: 30.01.2012; LatestRevisionDate: 30.01.2012
J6 = L-KLS1-233-0-0-0-T: CONNECTOR USB MICRO B TYPE FEMALE SMT R/A W/O POST
J7 J9 = SAMTEC_SSW-106-01-L-S: Connector 6 Female; Part Description: 6 Contacts, Pitch 2.54mm, Single Row Through Mount Straight Socket (Lead Length 2.64mm); Manufacturer: SAMTEC; PressFit: No; Part Number: SAMTEC_SSW-106-01-L-S; Component Kind: Standard; Component Type: Standard; Pin Count: 6; Family: Socket 6; Mounted: Yes; Socket: No; SMD: No; Sense: No; Status: None; Manufacturer Part Number: SSW-106-01-L-S; ComponentHeight: 8.51mm; HelpURL: \\cern.ch\dfs\Applications\Altium\Datasheets\SAMTEC_SSW-106-01-L-S.pdf; Author: CERN DEM BC; CreateDate: 29.09.2021; LatestRevisionDate: 29.09.2021
J8 J10 = 3 Pin Female Header: 3 Pin Female Header 2.54mm pitch
J11 J13 = SAMTEC_HTSW-101-23-L-D: Connector 2 Male; Part Description: 2 Contacts, Pitch 2.54mm, Dual Row Through Mount Straight Header (Post Lead 5.84mm, Tail Lead 2.92mm, Insulator 2.54mm); Manufacturer: SAMTEC; PressFit: No; Status Comment: High Temperature; Part Number: SAMTEC_HTSW-101-23-L-D; Component Kind: Standard; Component Type: Standard; Pin Count: 2; Family: Header 2; Mounted: Yes; Socket: No; SMD: No; Sense: No; Status: Preferred; Manufacturer Part Number: HTSW-101-23-L-D; ComponentHeight: 8.38mm; HelpURL: \\cern.ch\dfs\Applications\Altium\Datasheets\SAMTEC_HTSW-101-23-L-D.pdf; Author: CERN DEM JLC; CreateDate: 22.02.2018; LatestRevisionDate: 22.02.2018
R8 R11-R13 = R0603_10K_1%_0.1W_100PPM: as R2 on sheet Core; Part Number: R0603_10K_1%_0.1W_100PPM; Component Kind: Standard; Component Type: Standard; Pin Count: 2; Value: 10k; Status: Preferred; Manufacturer Part Number: R0603_10K_1%_0.1W_100PPM; Case: 0603; Mounted: Yes; Sense: No; Socket: No; SMD: Yes; Manufacturer1 Example: NIC COMPONENT; Manufacturer1 ComponentHeight: 0.55mm; HelpURL: \\cern.ch\dfs\Applications\Altium\Datasheets\R0603_NIC_NRC.pdf; Author: CERN DEM JLC; CreateDate: 3.12.2007; LatestRevisionDate: 13.03.2008
R9 = R0603_36K_1%_0.1W_100PPM: Resistor - 1%; Part Description: General Purpose Thick Film Chip Resistor; Manufacturer: GENERIC; Manufacturer1 Part Number: NRC06F3602TRF; Power: 0.1W; TC: ±100ppm/°C; PressFit: No; Part Number: R0603_36K_1%_0.1W_100PPM; Component Kind: Standard; Component Type: Standard; Pin Count: 2; Value: 36k; Status: Preferred; Manufacturer Part Number: R0603_36K_1%_0.1W_100PPM; Case: 0603; Mounted: Yes; Sense: No; Socket: No; SMD: Yes; Manufacturer1 Example: NIC COMPONENT; Manufacturer1 ComponentHeight: 0.55mm; HelpURL: \\cern.ch\dfs\Applications\Altium\Datasheets\R0603_NIC_NRC.pdf; Author: CERN DEM JLC; CreateDate: 3.12.2007; LatestRevisionDate: 13.03.2008
R10 = R0603_1K5_1%_0.1W_100PPM: Resistor - 1%; Part Description: General Purpose Thick Film Chip Resistor; Manufacturer: GENERIC; Manufacturer1 Part Number: NRC06F1501TRF; Power: 0.1W; TC: ±100ppm/°C; PressFit: No; Part Number: R0603_1K5_1%_0.1W_100PPM; Component Kind: Standard; Component Type: Standard; Pin Count: 2; Value: 1k5; Status: Preferred; Manufacturer Part Number: R0603_1K5_1%_0.1W_100PPM; Case: 0603; Mounted: Yes; Sense: No; Socket: No; SMD: Yes; Manufacturer1 Example: NIC COMPONENT; Manufacturer1 ComponentHeight: 0.55mm; HelpURL: \\cern.ch\dfs\Applications\Altium\Datasheets\R0603_NIC_NRC.pdf; Author: CERN DEM JLC; CreateDate: 3.12.2007; LatestRevisionDate: 13.03.2008
R14 R15 = R0603_120R_1%_0.1W_100PPM: Resistor - 1%; Part Description: General Purpose Thick Film Chip Resistor; Manufacturer: GENERIC; Manufacturer1 Part Number: NRC06F1200TRF; Power: 0.1W; TC: ±100ppm/°C; PressFit: No; Part Number: R0603_120R_1%_0.1W_100PPM; Component Kind: Standard; Component Type: Standard; Pin Count: 2; Value: 120; Status: Preferred; Manufacturer Part Number: R0603_120R_1%_0.1W_100PPM; Case: 0603; Mounted: Yes; Sense: No; Socket: No; SMD: Yes; Manufacturer1 Example: NIC COMPONENT; Manufacturer1 ComponentHeight: 0.55mm; HelpURL: \\cern.ch\dfs\Applications\Altium\Datasheets\R0603_NIC_NRC.pdf; Author: CERN DEM JLC; CreateDate: 3.12.2007; LatestRevisionDate: 13.03.2008
R16 R17 = R0603_4K7_1%_0.1W_100PPM: as R3 on sheet Power; Part Number: R0603_4K7_1%_0.1W_100PPM; Component Kind: Standard; Component Type: Standard; Pin Count: 2; Value: 4k7; Status: Preferred; Manufacturer Part Number: R0603_4K7_1%_0.1W_100PPM; Case: 0603; Mounted: Yes; Sense: No; Socket: No; SMD: Yes; Manufacturer1 Example: NIC COMPONENT; Manufacturer1 ComponentHeight: 0.55mm; HelpURL: \\cern.ch\dfs\Applications\Altium\Datasheets\R0603_NIC_NRC.pdf; Author: CERN DEM JLC; CreateDate: 3.12.2007; LatestRevisionDate: 13.03.2008
SW1 = DS1040 2-DIP SW: SWITCH DIP 2 Pos. SPST 100mA 24VDC THT V/T
T1 = BC817-40: NPN Transistor; Part Description: 45V 500mA NPN General-Purpose Transistor; Manufacturer: NXP SEMICONDUCTORS; PressFit: No; Bonding: No; Part Number: BC817-40; Component Kind: Standard; Component Type: Standard; Device: BC817-40; PackageDescription: SOT23, 0.95mm Pitch; 3 Pin, 1.30mm W X 2.90mm L X 1.10mm H body, IPC Medium Density; Manufacturer Part Number: BC817-40; Pin Count: 3; Case: SOT23-3; Mounted: Yes; Socket: No; SMD: Yes; Sense: No; ComponentHeight: 1.1mm; HelpURL: \\cern.ch\dfs\Applications\Altium\Datasheets\BC817-40.pdf; Author: CERN DEM BC; CreateDate: 29.04.2020; LatestRevisionDate: 29.04.2020
U3 = TPT1255 CAN TRANSCIEVER: IC-1255 TRANSCEIVER CAN 8-SOP
U4 = TPT487 RS485 Transciever: IC-487 TRANSCEIVER 1/1 8-SOP

## Nets that join several sheets
+3V3: Core (13 pins), Power (C17.2 IC1.2 IC1.4), Com (8 pins)
+5V: Core (J2.13), Power (5 pins), Com (C22.2 D5.1 J9.5 U3.VCC)
GND: Core (25 pins), Power (22 pins), Com (21 pins)
CAN_RX: Core (U1.45), Com (U3.RXD)
CAN_S: Core (U1.38), Com (R11.1 U3.S)
CAN_TX: Core (U1.46), Com (U3.TXD)
CS: Core (U1.28), Com (J7.6 R12.2)
CTRL1: Core (U1.10), Com (J9.1)
CTRL2: Core (U1.11), Com (J9.2)
CTRL3: Core (U1.29), Com (J9.3)
CTRL4: Core (U1.18), Com (J9.4)
I2C_SCL: Core (U1.42), Com (J12.3 J13.2 J14.3)
I2C_SDA: Core (U1.43), Com (J11.2 J12.4 J14.4)
MISO: Core (U1.40), Com (J7.5)
MOSI: Core (U1.41), Com (J7.4)
RS485_DE: Core (U1.27), Com (R13.2 U4.!RE U4.DE)
RS485_UART_RX: Core (U1.22), Com (U4.R)
RS485_UART_TX: Core (U1.21), Com (U4.D)
SCK: Core (U1.15), Com (J7.3)
UART_RX: Core (U1.31), Com (J5.2)
UART_TX: Core (U1.30), Com (J5.3)
USB_5V: Power (C19.2 IC2.IN2), Com (J6.1 R8.2 T1.3)
USB_D+: Core (U1.33), Com (D6.2 J6.3 R10.2)
USB_D-: Core (U1.32), Com (D7.2 J6.2)